# EasyEDA Pro project li-chuang-kai-fa-ban-li-chuang-esp32s3r8n8-kai-fa-ban-cb10375b.epro, board 立创ESP32S3R8N8开发板PCB
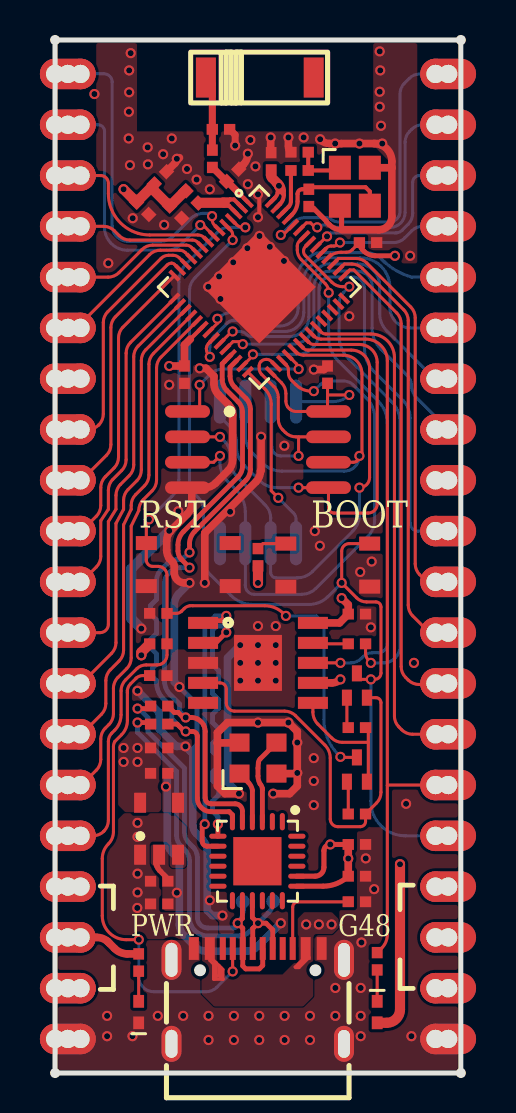
[diagram p2: board, top side]
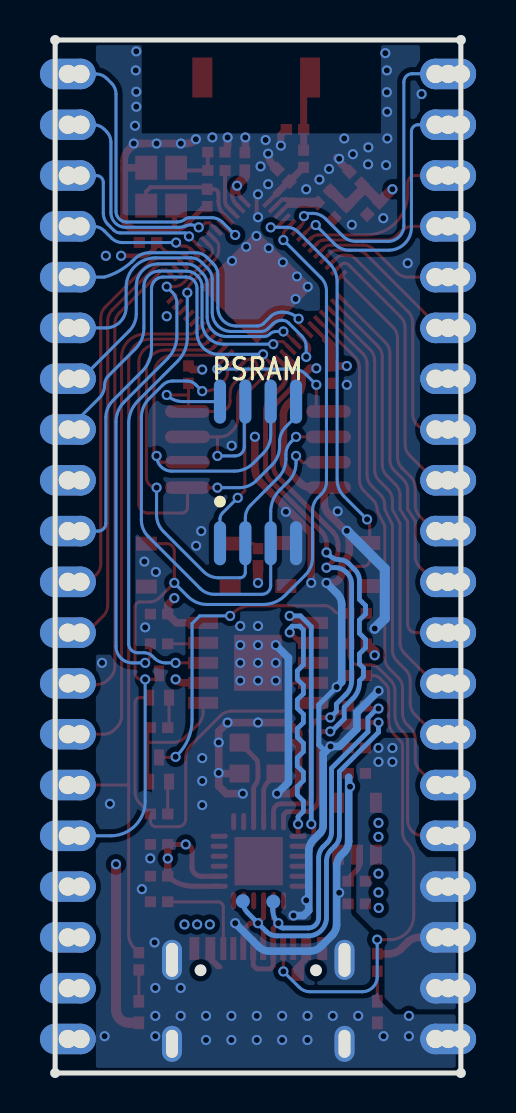
[diagram p3: board, bottom side, seen from below]

Outline 20.32 x 51.66 mm; copper layers: Top Layer, GND, VCC, Bottom Layer. Coordinates in mm from the lower left corner of the outline.
Outline path: 0,51.66 0,0 20.32,0 20.32,51.66 0,51.66
Stack: Top Layer 0.035mm 外层铜厚1oz / Dielectric1 0.2104mm 7628 RC49% 8.6mil / GND 0.0152mm 内层铜厚 / Dielectric2 1.065mm 1.1mm H/HOZ 含铜 / VCC 0.0152mm 内层铜厚 / Dielectric3 0.2104mm 7628 RC49% 8.6mil / Bottom Layer 0.035mm 外层铜厚1oz

## Design rules (mm)
net D4-: DP2
net D4+: DP2
net USB_D+: DP1
net USB_D-: DP1
net D3+: DP3
net D3-: DP3
spacing copperThickness1oz (default): track to track 0.102, other pairs 0 to 0.3
spacing copperThickness2oz: track to track 0.203, other pairs 0.152 to 0.3
spacing Plane_innerPlane: track to track 0.102, other pairs 0 to 0.3
spacing Copper_copperRegion: track to track 0.102, other pairs 0 to 0.3
track width copperThickness1oz (default): min 0.152, default 0.203, max 2.54
track width copperThickness2oz: min 0.203, default 0.254, max 2.54
differential pair 90Ω (default): width min 0.241, default 0.241, max 0.241; gap min 0.152, default 0.152
region e1 uses Copper_copperRegion
region e2 uses Copper_copperRegion
region e3 uses Copper_copperRegion
pour e1339 uses Copper_copperRegion
pour e1341 uses Copper_copperRegion
pour e1343 uses Copper_copperRegion
pour e1345 uses Copper_copperRegion
pour e1347 uses Copper_copperRegion
pour e1358 uses Copper_copperRegion

## Placement (name value [footprint] x y rotation side)
BOOT  TSA016A2518A  [KEY-SMD_4P-L4.2-W3.4-P2.15-LS4.5-TL]  13.65 25.4 0 top
C19  100nF  [R0402]  6.03 43.05 135 top
C20  100nF  [R0402]  15.67 41.53 180 top
C21  100nF  [R0402]  10.82 45.59 270 top
C22  100nF  [R0402]  6.48 34.92 90 top
C23  100nF  [R0402]  13.64 34.92 270 top
C25  1uF  [R0402]  5.17 22.99 0 top
C33  10pF  [R0402]  12.24 46.05 0 top
C34  10pF  [R0402]  12.7 43.76 270 top
C41  100nF  [R0402]  15.11 22.95 180 top
C46  10uF  [R0402]  5.21 8.46 180 top
C47  10uF  [R0402]  4.38 43.24 135 top
C48  10uF  [R0402]  15.11 9.84 180 top
C49  100nF  [R0402]  15.11 11.43 180 top
C50  1uF  [R0402]  5.27 44.77 225 top
C51  100nF  [R0402]  5.21 16.26 180 top
C52  100nF  [R0402]  5.21 9.59 180 top
C53  10uF  [R0402]  5.21 14.99 180 top
C54  8.2pF  [r0402]  7.87 45.72 270 top
J1  -  [半孔-孔-20P-2.54-1.27-无丝印]  19.05 25.83 90 top
J2  -  [半孔-孔-20p-2.54-1.27-无丝印]  0 25.83 90 top
L4  2nH  [R0402]  6.86 43.81 315 top
L6  39nH  [r0402]  8.89 44.89 45 top
L7  1.3nH  [r0402]  8.31 47.19 0 top
L8  24nH  [r0402]  12.24 45.14 0 top
LED1  XL-1005UGC  [LED0402-RD_GREEN]  16.13 3.05 270 top
PWR  NCD0402R1  [LED0402-RD]  4.18 3.05 90 top
Q1  MMBT3904T  [SOT-523_L1.6-W0.8-P1.00-BL]  15.11 19.38 0 top
Q2  MMBT3904T  [SOT-523_L1.6-W0.8-P1.00-BL]  15.11 15.18 0 top
R13  4.7kΩ  [R0402]  4.18 5.52 270 top
R14  4.7kΩ  [R0402]  10.16 25.79 270 top
R15  4.7kΩ  [R0402]  5.17 21.46 180 top
R16  4.7kΩ  [R0402]  15.11 12.95 180 top
R17  4.7kΩ  [R0402]  15.11 17.27 180 top
R18  5.1kΩ  [R0402]  5.17 19.88 180 top
R19  5.1kΩ  [R0402]  15.11 8.56 180 top
R22  0Ω  [R0402]  5.21 17.45 0 top
R23  0Ω  [R0402]  5.21 18.35 0 top
R24  499Ω  [R0402]  15.11 21.46 180 top
R25  15kΩ  [R0402]  16.13 5.59 90 top
RST  TSA016A2518A  [KEY-SMD_4P-L4.2-W3.4-P2.15-LS4.5-TL]  6.67 25.43 180 top
TP1  -  [test-point-0.5mm]  10.92 8.59 180 bottom
TP2  -  [test-point-0.5mm]  9.4 8.57 180 bottom
U2  USB-TYPE-C-019  [TYPE-C-SMD_HX-TYPE-C-16PIN]  10.15 3.84 0 top
U3  ESP32-S3(R8)  [QFN-56_L7.0-W7.0-P0.40-TL-EP4.0]  10.22 39.31 315 top
U4  -  [SOP-8_L5.3-W5.3-P1.27-LS8.0-BL]  10.16 30.04 180 bottom
U5  BY25Q64ASSIG(T)  [SOIC-8_L5.3-W5.3-P1.27-LS8.0-BL]  10.16 31.18 270 top
U6  ME6217C33M5G  [sot-23-5_l3.0-w1.7-p0.95-ls2.8-br]  5.21 12.22 270 top
U16  CH334F  [qfn24_4x4]  10.13 10.59 180 top
U24  CH340K  [ESOP-10_L4.9-W3.9-P1.00-LS6.2-BL-EP]  10.16 20.51 270 top
U25  RFANT5220110A0T  [FILTER-SMD_L5.2-W2.0-L]  10.25 49.78 0 top
X1  40MHz  [crystal-smd_4p-l2.5-w2.0-bl]  15.01 44.32 270 top
X2  12MHz  [crystal-smd_4p-l2.5-w2.0-bl-a]  10.16 15.75 0 top

## Footprints (pads in the part's own frame, mm; a bottom-side part is the same pattern mirrored in y, then rotated)
crystal-smd_4p-l2.5-w2.0-bl
  rect 1.2x1.1 smd: 1(-0.95,-0.75) 2(0.95,-0.75) 3(0.95,0.75) 4(-0.95,0.75)
crystal-smd_4p-l2.5-w2.0-bl-a
  rect 1x0.9 smd: 1(-0.925,-0.775) 2(0.925,-0.775) 3(0.925,0.775) 4(-0.925,0.775)
ESOP-10_L4.9-W3.9-P1.00-LS6.2-BL-EP
  rect 0.6x1.5 smd: 1(-2,-2.75) 2(-1,-2.75) 3(0,-2.75) 4(1,-2.75) 5(2,-2.75) 6(2,2.75) 7(1,2.75) 8(0,2.75) 9(-1,2.75) 10(-2,2.75)
  rect 2.8x2.4 smd: 11(0,0)
FILTER-SMD_L5.2-W2.0-L
  rect 1x2 smd: 1(-2.7,0) 2(2.7,0)
KEY-SMD_4P-L4.2-W3.4-P2.15-LS4.5-TL
  rect 1.05x0.7 smd: 1(-2.1,1.075) 2(2.1,1.075) 3(-2.1,-1.075) 4(2.1,-1.075)
LED0402-RD
  rect 0.636x0.54 smd: 1(-0.538,0) 2(0.538,0)
LED0402-RD_GREEN
  rect 0.636x0.54 smd: 1(-0.538,0) 2(0.538,0)
qfn24_4x4
  rect 2.413x2.413 smd: 0(0,0)
  oval 0.25x0.864 smd: 1(-1.25,-1.976) 2(-0.75,-1.976) 3(-0.25,-1.976) 4(0.25,-1.976) 5(0.75,-1.976) 6(1.25,-1.976) 13(1.25,1.976) 14(0.75,1.976) 15(0.25,1.976) 16(-0.25,1.976) 17(-0.75,1.976) 18(-1.25,1.976)
  oval 0.864x0.25 smd: 7(1.976,-1.25) 8(1.976,-0.75) 9(1.976,-0.25) 10(1.976,0.25) 11(1.976,0.75) 12(1.976,1.25) 19(-1.976,1.25) 20(-1.976,0.75) 21(-1.976,0.25) 22(-1.976,-0.25) 23(-1.976,-0.75) 24(-1.976,-1.25)
QFN-56_L7.0-W7.0-P0.40-TL-EP4.0
  rect 0.665x0.2 smd: 1(-3.408,2.6) 2(-3.407,2.2) 3(-3.408,1.8) 4(-3.408,1.4) 5(-3.408,1) 6(-3.407,0.6) 7(-3.408,0.2) 8(-3.408,-0.2) 9(-3.407,-0.6) 10(-3.408,-1) 11(-3.408,-1.4) 12(-3.408,-1.8) 13(-3.407,-2.2) 14(-3.408,-2.6) 29(3.408,-2.6) 30(3.407,-2.2) 31(3.408,-1.8) 32(3.408,-1.4) 33(3.408,-1) 34(3.407,-0.6) 35(3.408,-0.2) 36(3.408,0.2) 37(3.407,0.6) 38(3.408,1) 39(3.408,1.4) 40(3.408,1.8) 41(3.407,2.2) 42(3.408,2.6)
  rect 0.2x0.665 smd: 15(-2.6,-3.408) 16(-2.2,-3.407) 17(-1.8,-3.408) 18(-1.4,-3.408) 19(-1,-3.408) 20(-0.6,-3.407) 21(-0.2,-3.408) 22(0.2,-3.408) 23(0.6,-3.407) 24(1,-3.408) 25(1.4,-3.408) 26(1.8,-3.408) 27(2.2,-3.407) 28(2.6,-3.408) 43(2.6,3.408) 44(2.2,3.407) 45(1.8,3.408) 46(1.4,3.408) 47(1,3.408) 48(0.6,3.407) 49(0.2,3.408) 50(-0.2,3.408) 51(-0.6,3.407) 52(-1,3.408) 53(-1.4,3.408) 54(-1.8,3.408) 55(-2.2,3.407) 56(-2.6,3.408)
  rect 4x4 smd: 57(0,0)
r0402
  rect 0.566x0.54 smd: 1(-0.433,0) 2(0.433,0)
R0402
  rect 0.566x0.54 smd: 1(-0.433,0) 2(0.433,0)
SOIC-8_L5.3-W5.3-P1.27-LS8.0-BL
  oval 0.63x2.25 smd: 1(-1.905,-3.53) 2(-0.635,-3.53) 3(0.635,-3.53) 4(1.905,-3.53) 5(1.905,3.53) 6(0.635,3.53) 7(-0.635,3.53) 8(-1.905,3.53)
SOP-8_L5.3-W5.3-P1.27-LS8.0-BL
  oval 0.609x2.204 smd: 1(-1.905,-3.542) 2(-0.635,-3.542) 3(0.635,-3.542) 4(1.905,-3.542) 5(1.905,3.542) 6(0.635,3.542) 7(-0.635,3.542) 8(-1.905,3.542)
sot-23-5_l3.0-w1.7-p0.95-ls2.8-br
  rect 1x0.6 smd: 1(1.3,-0.95) 2(1.3,0) 3(1.3,0.95) 4(-1.3,0.95) 5(-1.3,-0.95)
SOT-523_L1.6-W0.8-P1.00-BL
  rect 0.5x0.8 smd: 1(-0.5,-0.608) 2(0.5,-0.608) 3(0,0.608)
test-point-0.5mm
  round 0.7 smd: 1(0,0)
TYPE-C-SMD_HX-TYPE-C-16PIN
  oval 1x2 hole 0.6x1.7: 1(-4.32,1.816) 1(4.32,1.816)
  oval 1x1.8 hole 0.6x1.4: 1(-4.32,-2.384) 1(4.32,-2.384)
  rect 0.5x1.14 smd: A1(-3.2,2.384) A4(-2.4,2.384) A9(2.4,2.384) A12(3.2,2.384)
  rect 0.3x1.14 smd: A5(-1.25,2.383) A6(-0.25,2.383) A7(0.25,2.383) A8(1.25,2.384) B5(1.75,2.383) B6(0.75,2.383) B7(-0.75,2.383) B8(-1.75,2.384)
半孔-孔-20p-2.54-1.27-无丝印
  round 1.524 hole 0.914: 1(-24.13,0) 1(-24.13,-1.27) 2(-21.59,0) 2(-21.59,-1.27) 3(-19.05,0) 3(-19.05,-1.27) 4(-16.51,0) 4(-16.51,-1.27) 5(-13.97,0) 5(-13.97,-1.27) 6(-11.43,0) 6(-11.43,-1.27) 7(-8.89,0) 7(-8.89,-1.27) 8(-6.35,0) 8(-6.35,-1.27) 9(-3.81,0) 9(-3.81,-1.27) 10(-1.27,0) 10(-1.27,-1.27) 11(1.27,0) 11(1.27,-1.27) 12(3.81,0) 12(3.81,-1.27) 13(6.35,0) 13(6.35,-1.27) 14(8.89,0) 14(8.89,-1.27) 15(11.43,0) 15(11.43,-1.27) 16(13.97,0) 16(13.97,-1.27) 17(16.51,0) 17(16.51,-1.27) 18(19.05,0) 18(19.05,-1.27) 19(21.59,0) 19(21.59,-1.27) 20(24.13,0) 20(24.13,-1.27)
  oval 1.524x2.794 hole 0.914: 1(-24.13,-0.635) 2(-21.59,-0.635) 3(-19.05,-0.635) 4(-16.51,-0.635) 5(-13.97,-0.635) 6(-11.43,-0.635) 7(-8.89,-0.635) 8(-6.35,-0.635) 9(-3.81,-0.635) 10(-1.27,-0.635) 11(1.27,-0.635) 12(3.81,-0.635) 13(6.35,-0.635) 14(8.89,-0.635) 15(11.43,-0.635) 16(13.97,-0.635) 17(16.51,-0.635) 18(19.05,-0.635) 19(21.59,-0.635) 20(24.13,-0.635)
半孔-孔-20P-2.54-1.27-无丝印
  round 1.524 hole 0.914: 1(-24.13,0) 2(-21.59,0) 3(-19.05,0) 4(-16.51,0) 5(-13.97,0) 6(-11.43,0) 7(-8.89,0) 8(-6.35,0) 9(-3.81,0) 10(-1.27,0) 11(1.27,0) 12(3.81,0) 13(6.35,0) 14(8.89,0) 15(11.43,0) 16(13.97,0) 17(16.51,0) 18(19.05,0) 19(21.59,0) 20(24.13,0)
  oval 1.524x2.794 hole 0.914: 1(-24.13,-0.635) 2(-21.59,-0.635) 3(-19.05,-0.635) 4(-16.51,-0.635) 5(-13.97,-0.635) 6(-11.43,-0.635) 7(-8.89,-0.635) 8(-6.35,-0.635) 9(-3.81,-0.635) 10(-1.27,-0.635) 11(1.27,-0.635) 12(3.81,-0.635) 13(6.35,-0.635) 14(8.89,-0.635) 15(11.43,-0.635) 16(13.97,-0.635) 17(16.51,-0.635) 18(19.05,-0.635) 19(21.59,-0.635) 20(24.13,-0.635)

## Nets
As in the schematic.

Pads without a net: RST 3; U2 A8 B8; U16 1 2 9 10 11 12 13 16 17 18 21 22 23 24; U24 5; U25 2

## Via types
v1: diameter 0.508, hole 0.305, Top Layer to Bottom Layer, 187 vias

## Routing (per net, layer and track width the routed paths; a pad name or vN(x,y) marks a point on that pad's centre or on a via; arc(x,y) is an arc through that point)
3V3: length 44.9
  Top Layer w0.152: 14.88,41.17 C20.2 ; 13.62,40.73 13.67,40.78 arc(13.97,40.98) 14.33,41.05 14.58,41.05 arc(14.74,41.08) 14.88,41.17
  Top Layer w0.203: 11.15,44.03 11.15,44.04 arc(11.14,44.16) 11.1,44.28 ; 11.15,44.03 arc(11.17,44.11) 11.18,44.2 ; 11.15,44.03 arc(11.09,43.88) 10.99,43.75 U3.56 ; 6.73,36.7 6.77,36.7 7.39,37.32 ; 11.46,43.92 11.18,44.2 ; 11.46,43.92 11.46,44.12 ; 11.46,43.92 arc(11.41,43.67) 11.27,43.46 U3.55 ; 11.18,44.2 arc(11.14,44.24) 11.1,44.28 ; 11.46,44.12 v1(11.21,44.37) 10.97,44.61 arc(10.93,44.63) 10.89,44.64 ; 11.46,44.12 arc(11.41,44.35) 11.28,44.55 10.93,44.9 arc(10.85,45.02) C21.2 10.82,45.05 arc(10.84,44.85) 10.89,44.64 ; 10.99,44.44 10.75,44.68 arc(10.68,44.78) 10.66,44.9 ; 10.99,44.44 arc(11.05,44.36) 11.1,44.28 ; 10.99,44.44 arc(11.04,44.36) 11.1,44.28 ; 10.99,44.44 arc(10.94,44.54) 10.89,44.64
  Top Layer w0.241: v1(17.02,40.87) 16.02,40.87 arc(15.72,40.93) 15.47,41.1 15.38,41.18 arc(15.28,41.34) C20.2
  Top Layer w0.254: 14.68,11.43 v1(13.78,11.43) arc(13.55,11.34) 13.46,11.11 13.46,10.29 arc(13.33,9.97) 13.02,9.84 U16.20 ; U16.19 13.42,9.34 arc(14.1,9.47) 14.68,9.84
  Top Layer w0.381: U24.7 13.87,19.51 arc(14.09,19.56) v1(14.29,19.69) ; 0.62,6.78 J2.3 2.09,6.78 arc(2.37,6.73) 2.62,6.59 ; 14.68,9.84 v1(14.68,10.73) 14.68,11.43 ; 6.77,36.7 6.48,36.41 C22.2 v1(5.72,35.36) ; U24.10 14.24,22.51 14.68,22.95 14.68,23.42 v1(14.35,23.75) ; 2.62,6.59 2.98,6.23 arc(3.27,6.03) 3.61,5.96 R13.1 ; 2.62,6.59 arc(2.67,6.54) 2.72,6.48
  Top Layer w0.508: 6.55,44.15 5.76,43.36 C19.2 4.81,44.28 ; 4.81,44.28 4.96,44.44 C50.2 ; 4.81,44.28 C47.2 v1(3.43,44.2) ; 4.74,21.46 4.32,21.04 v1(4.32,20.89) ; R14.2 v1(10.16,24.51) ; v1(17.27,10.44) 17.27,3.17 arc(17.08,2.7) 16.61,2.51 LED1.2
  vias: v1(3.43,16.26) v1(3.43,15.56) v1(4.13,16.26) v1(4.13,15.56)
+5V: length 9.2
  Top Layer w0.152: 7.93,4.84 7.93,5.44 7.75,5.63 7.75,5.83 ; 7.93,4.84 8.06,4.84 ; 7.93,4.84 7.93,4.7 7.95,4.68 8.41,4.68 8.4,4.69 ; 8.06,4.84 8.04,4.86 8.04,5.53 ; 8.06,4.84 8.26,4.84 ; 8.06,4.84 8.06,5.51 ; 8.3,5.28 8.4,5.17 8.4,4.69 ; 8.3,5.28 8.3,4.87 8.26,4.84 ; 8.3,5.28 8.2,5.37 ; 12.12,5.3 12.55,5.73 12.55,5.83 ; 8.26,4.84 8.2,4.89 8.2,5.37 ; 8.26,4.84 8.4,4.69 ; 8.2,5.37 8.06,5.51 ; 12.72,5.78 12.72,5.78 12.21,5.27 12.05,5.27 12.02,5.3 12.55,5.83 ; 12.55,5.83 U2.A9 ; 8.04,5.53 8.06,5.51 ; 8.04,5.53 7.75,5.83 ; 7.75,5.83 U2.A4
  vias: v1(4.13,12.51) v1(4.13,11.81) v1(4.13,9.97) v1(4.13,9.03) v1(4.12,8.25) v1(12.57,7.43) v1(13.21,7.43) v1(13.84,7.43)
GND: length 110.6
  Top Layer w0.152: 5.64,9.8 5.32,10.12 arc(5.19,10.32) 5.14,10.55 ; 5.45,9.84 5.19,10.09 arc(5.04,10.32) 4.99,10.59
  Top Layer w0.203: v1(10.16,43.94) 10.23,43.88 10.23,42.87 v1(10.16,42.8)
  Top Layer w0.254: X1.2 arc(14.32,43.28) 14.35,43.17 14.35,42.17 arc(14.02,42.24) 13.74,42.42 13.59,42.57 arc(13.58,42.59) 13.57,42.61 12.96,43.23 arc(12.84,43.3) 12.7,43.33
  Top Layer w0.35: 8.74,47.19 9.02,46.92 v1(9.02,46.38)
  Top Layer w0.381: C50.1 6.01,45.5 arc(6.07,45.6) v1(6.1,45.72) arc(6.17,45.73) 6.23,45.77 ; v1(7.24,35.24) 7.56,35.24 7.95,34.84 7.95,34.47 arc(8.01,34.18) 8.18,33.93 8.67,33.44 arc(8.83,33.19) 8.89,32.9 8.89,30.67 arc(8.83,30.38) 8.67,30.13 8.03,29.5 arc(7.79,29.33) 7.5,29.27 U5.4 6.85,29.06 6.85,28.5 arc(6.79,28.21) 6.62,27.96 5.81,27.15 arc(5.72,27.03) 5.65,26.9 arc(5.6,26.76) 5.59,26.61 5.59,26.15 arc(5.62,25.92) 5.72,25.71 5.87,25.57 arc(5.94,25.46) 5.97,25.33 5.97,25.02 arc(6.12,24.66) 6.48,24.51 v1(6.73,24.51) ; 8.13,16.51 8.13,14.35 8.51,13.97 v1(9.21,13.97) ; 8.13,16.51 8.13,17.02 8.64,17.53 v1(10.16,17.53) v1(11.68,17.53) 12.13,17.08 v1(12.13,16.53) v1(12.13,15.01) ; 8.13,16.51 9.22,16.51 9.24,16.52 ; v1(10.31,31.82) 10.31,30.14 10.29,30.11 arc(10.23,29.82) 10.06,29.57 7.5,27.01 v1(7.5,24.51) ; v1(14.03,46.48) 13.74,46.48 arc(13.51,46.53) 13.31,46.66 v1(13.27,46.7) ; v1(12.13,15.01) 12.13,14.35 11.75,13.97 v1(10.92,13.97) ; v1(12.13,15.01) 12.09,14.97 X2.2 ; v1(12.95,35.18) 13.46,35.18 C23.1 ; v1(10.79,46.79) 10.79,46.09 arc(10.8,46.05) C21.1 ; 16.87,45.27 16.87,42.82 arc(16.67,42.36) 16.21,42.17 14.35,42.17 ; 16.87,45.27 16.87,45.59 arc(16.72,46.07) 16.35,46.4 arc(16.17,46.46) 15.98,46.48 ; 16.87,45.27 X1.4 ; v1(16.38,46.48) 15.98,46.48 ; 15.98,46.48 v1(15.24,46.48) 14.34,46.48 arc(14.19,46.47) 14.05,46.42 ; L6.2 9.43,45.43 arc(9.59,45.68) v1(9.65,45.97) ; v1(11.68,46.79) 11.68,46.35 arc(11.72,46.19) C33.1
  Bottom Layer w0.254: 6.78,16.08 7.11,16.41 7.11,18.42 v1(6.22,19.3)
  Bottom Layer w0.381: v1(9.21,13.97) 8.64,14.54 8.64,20.76 v1(9.27,21.4) ; v1(8.38,7.87) 7.87,7.87 7.62,8.13 7.62,11.11 arc(7.56,11.41) 7.4,11.65 7.05,12 arc(6.94,12.17) 6.9,12.37 6.9,15.96 v1(6.53,16.33) 6.08,16.33 5.21,17.21 5.21,18.03 v1(4.13,19.11) ; v1(11.3,7.49) 10.13,6.32 arc(9.88,6.15) 9.59,6.1 7.55,6.1 arc(7.26,6.15) 7.02,6.32 6.45,6.89 arc(6.28,7.14) 6.22,7.43 6.22,10.35 arc(6.16,10.64) 6,10.89 5.84,11.05 arc(5.68,11.3) 5.62,11.59 5.62,14.79 ; v1(6.22,19.3) 5.97,19.56 5.97,23.43 arc(6.03,23.72) 6.19,23.97 v1(6.73,24.51)
  Bottom Layer w0.508: v1(4.32,22.22) 3.81,22.73 3.81,25.21 v1(5.72,27.11)
  vias: v1(1.97,48.96) v1(2.6,2.86) v1(2.6,1.84) v1(2.66,40.5) v1(3.71,50.14) v1(3.71,49.05) v1(3.7,48.07) v1(3.68,46.74) v1(3.75,45.4) v1(3.78,51) v1(3.89,42.75) v1(3.87,1.84) v1(4.64,46.29) v1(4.65,45.44) v1(5.14,2.86) v1(5.41,45.95) v1(5.46,42.42) v1(5.55,14.32) v1(5.72,34.42) v1(5.84,46.74) v1(6.1,9.02) v1(6.17,28.09) v1(6.41,2.86) v1(6.6,45.21) v1(7.08,44.68) v1(7.75,44.2) v1(7.67,39.32) v1(7.75,8.64) v1(7.68,2.86) v1(7.68,1.65) v1(8.21,39.84) v1(8.28,38.71) v1(8.76,28.07) v1(8.92,40.54) v1(8.95,2.86) v1(8.95,1.65) v1(9.27,20.51) v1(9.27,19.62) v1(9.63,41.25) v1(9.65,44.45) v1(9.78,46.66) v1(10.03,45.34) v1(10.24,41.86) v1(10.16,22.35) v1(10.16,21.4) v1(10.16,20.51) v1(10.16,19.62) v1(10.22,2.86) v1(10.22,1.65) v1(10.75,41.32) v1(11.05,22.35) v1(11.05,21.4) v1(11.05,20.51) v1(11.05,19.62) v1(11.46,40.61) v1(11.48,31.37) v1(11.49,2.86) v1(11.49,1.65) v1(12.45,46.79) v1(12.76,2.86) v1(12.76,1.65) v1(13,27.1) v1(12.95,15.75) v1(12.95,14.61) v1(12.95,13.4) v1(13.26,26.36) v1(14.03,4.25) v1(14.03,2.86) v1(14.73,37.85) v1(15.28,25.06) v1(15.34,6.53) v1(15.3,4.25) v1(15.3,2.86) v1(15.3,1.84) v1(15.56,10.73) v1(15.81,22.29) v1(15.85,25.58) v1(15.98,9.19) v1(16.26,51.09) v1(16.28,50.14) v1(16.26,49.07) v1(16.26,48.32) v1(16.32,47.37) v1(17.58,13.46) v1(17.78,40.87) v1(17.84,1.84) v1(17.97,20.51)
VDD_SPI: length 9.6
  Top Layer w0.152: 13.64,34.62 13.64,33.93 ; 13.64,33.93 13.64,33.13 U5.8 12.08,33.08 arc(11.92,33.11) 11.78,33.18 arc(11.71,33.24) 11.65,33.31 arc(11.58,33.45) 11.56,33.61 11.56,33.98 arc(11.5,34.27) 11.33,34.52 U3.29 ; 13.64,33.93 13.66,33.91 v1(14.73,33.91)
  Bottom Layer w0.152: U4.8 13.93,33.58 arc(14.37,33.66) v1(14.73,33.91)
340_RX: length 1.8
  Top Layer w0.152: U24.9 12.96,21.46 14.68,21.46
340_TX: length 26.3
  Top Layer w0.152: v1(13.7,39.02) 13.7,39.07 arc(13.66,39.29) 13.53,39.47 12.33,40.68 arc(12.18,40.9) 12.13,41.16 12.13,41.36 arc(12.15,41.48) 12.22,41.59 U3.50 ; U24.8 v1(14.29,20.51)
  Bottom Layer w0.152: v1(13.7,39.02) 13.7,36.78 arc(13.83,36.14) 14.19,35.59 16.17,33.61 arc(16.52,33.1) 16.64,32.49 16.64,21.47 arc(16.51,21.15) 16.19,21.02 15.88,21.02 arc(15.64,20.97) 15.44,20.84 15.34,20.74 arc(15.09,20.57) 14.79,20.51 v1(14.29,20.51)
CHIP_PU: length 53.3
  Top Layer w0.152: 5.6,22.99 5.6,24.89 arc(5.47,25.21) 5.16,25.34 4.89,25.34 arc(4.66,25.43) 4.57,25.66 RST.4 4.57,27.37 arc(4.6,27.54) v1(4.7,27.69) ; 5.6,22.99 5.6,20.91 arc(5.56,20.7) 5.43,20.53 arc(5.35,20.47) 5.26,20.43 arc(5.18,20.41) 5.1,20.41 4.56,20.41 arc(4.32,20.36) 4.1,20.23 3.53,19.66 arc(3.36,19.41) 3.3,19.1 3.3,17.91 arc(3.22,17.5) 2.98,17.14 2.84,17 arc(2.71,16.81) 2.67,16.58 2.67,12.63 arc(2.61,12.34) 2.44,12.1 2.43,12.08 arc(2.19,11.92) 1.89,11.86 J2.5 ; 5.6,22.99 6.07,22.99 arc(6.21,23.01) 6.33,23.09 ; v1(14.29,15.81) 14.31,15.78 Q2.3 ; U3.4 9.09,42.42 arc(9.23,42.33) 9.41,42.29 v1(9.53,42.29) ; v1(11.56,22.86) 11.44,22.98 arc(11.01,23.27) 10.5,23.37 6.89,23.37 arc(6.82,23.37) 6.75,23.37 arc(6.59,23.32) 6.46,23.22 6.33,23.09 ; 6.33,23.09 arc(6.33,23.1) 6.34,23.1
  Bottom Layer w0.152: v1(9.53,42.29) 8.7,42.29 arc(8.41,42.23) 8.16,42.07 6.59,40.5 arc(6.3,40.06) 6.2,39.55 6.2,29.67 arc(6.11,29.22) 5.85,28.84 v1(4.7,27.69) ; v1(14.29,15.81) 14.19,15.91 arc(13.65,16.72) 13.46,17.67 13.46,22.48 13.08,22.86 v1(11.56,22.86)
D3+: length 14.3
  Top Layer w0.241: v1(8.57,22.86) 8.33,22.62 7.52,22.62 U24.1 ; U16.8 7.62,11.34 arc(7.44,11.42) 7.37,11.59 7.37,12.32 v1(7.49,12.45)
  Bottom Layer w0.241: v1(8.57,22.86) 8.03,22.86 7.49,22.32 v1(7.49,12.45)
D3-: length 14.1
  Top Layer w0.241: U16.7 v1(8.15,12.45) ; U24.2 8.05,21.51 v1(8.57,22.03)
  Bottom Layer w0.241: v1(8.15,12.45) 8.15,12.82 7.89,13.09 7.89,13.6 8.19,13.9 8.19,14.32 7.89,14.63 7.89,15.05 8.19,15.35 8.19,15.77 7.89,16.08 7.89,16.49 8.19,16.8 8.19,17.22 7.89,17.52 7.89,17.94 8.19,18.25 8.19,18.67 7.89,18.97 7.89,19.39 8.19,19.69 8.19,20.11 7.89,20.42 7.89,22.16 8.07,22.35 8.45,22.35 8.57,22.22 v1(8.57,22.03)
D4+: length 29.8
  Top Layer w0.241: U16.6 8.88,12.91 8.72,13.07 7.81,13.07 arc(7.32,13.27) 7.12,13.75 7.12,16.84 arc(7.05,17.01) 6.88,17.08 v1(6.54,17.08) 6.48,17.08 6.11,17.45 R22.2 ; 9.09,35.62 8.76,35.3 8.76,34.85 arc(8.82,34.56) 8.98,34.31 9.56,33.74 arc(9.72,33.49) 9.78,33.2 9.78,30.19 arc(9.72,29.9) 9.56,29.65 6.98,27.08 arc(6.8,26.8) 6.73,26.47 v1(6.73,26.03)
  Bottom Layer w0.241: v1(6.73,26.03) 6.57,25.88 arc(6.34,25.72) 6.06,25.67 arc(5.83,25.62) 5.62,25.48 5.3,25.16 arc(5.14,24.92) 5.08,24.62 5.08,23.68 4.78,23.38 4.78,22.96 5.08,22.65 5.08,21.99 4.78,21.68 4.78,21.27 5.08,20.96 5.08,20.45 4.88,20.25 4.88,19.82 5.08,19.62 5.08,19.53 arc(5.17,19.09) 5.42,18.71 5.84,18.29 5.84,17.72 6.48,17.08 v1(6.54,17.08)
D4-: length 30
  Top Layer w0.241: R23.2 5.97,18.03 6.16,18.03 6.41,17.78 v1(6.54,17.78) 6.81,17.78 arc(6.97,17.76) 7.12,17.71 arc(7.31,17.57) 7.44,17.39 arc(7.5,17.23) 7.52,17.07 7.52,13.76 arc(7.6,13.55) 7.81,13.46 9.02,13.46 arc(9.27,13.36) 9.38,13.1 U16.5 ; U3.25 8.5,35.61 8.5,35.6 8.37,35.47 8.37,34.69 arc(8.42,34.39) 8.59,34.15 9.16,33.57 arc(9.33,33.33) 9.39,33.04 9.39,30.35 arc(9.33,30.06) 9.16,29.81 6.43,27.08 arc(6.22,26.77) 6.15,26.41 6.15,26.11 arc(6.19,25.91) 6.29,25.73 arc(6.31,25.71) 6.33,25.69 6.35,25.67 arc(6.54,25.47) v1(6.73,25.27)
  Bottom Layer w0.241: v1(6.54,17.78) 6.24,18.08 6.24,18.45 5.76,18.92 arc(5.55,19.24) 5.47,19.62 5.47,24.46 arc(5.53,24.75) 5.7,25 5.75,25.05 arc(5.99,25.22) 6.28,25.27 v1(6.73,25.27)
DTR: length 20.9
  Top Layer w0.152: U24.4 8.26,19.51 arc(8.48,19.42) 8.57,19.2 8.57,18.51 arc(8.69,18.22) 8.98,18.1 11.49,18.1 arc(11.79,18.04) 12.04,17.87 13.51,16.4 arc(13.71,16.1) 13.78,15.75 13.78,12.7 arc(13.89,12.43) 14.16,12.32 15.28,12.32 arc(15.47,12.4) 15.55,12.58 R16.1 16.1,13.51 arc(16.26,13.75) 16.32,14.04 16.32,18.52 arc(16.25,18.7) 16.07,18.77 Q1.2
GPIO0: length 47.9
  Top Layer w0.152: BOOT.2 14.73,26.47 arc(14.46,26.36) 14.35,26.1 v1(14.35,24.51) 15.1,23.76 arc(15.33,23.61) 15.59,23.56 16.07,23.56 arc(16.25,23.48) 16.32,23.3 16.32,20 arc(16.23,19.78) 16,19.69 v1(15.81,19.69) 15.24,19.69 15.11,19.81 15.11,19.99 ; v1(8.89,41.66) 8.89,41.92 arc(8.87,42.04) 8.8,42.15 8.52,42.42
  Bottom Layer w0.152: v1(14.35,24.51) 13.67,23.83 arc(13.23,23.53) 12.71,23.43 9.89,23.43 arc(9.31,23.55) 8.81,23.88 7.8,24.89 arc(7.53,25.3) 7.43,25.78 7.43,28.13 arc(7.36,28.48) 7.16,28.78 6.98,28.96 arc(6.8,29.24) 6.73,29.57 6.73,39.11 arc(6.8,39.47) 7.01,39.77 v1(8.89,41.66) ; v1(15.81,19.69) 15.81,13.59 arc(16.32,12.37) 17.54,11.86 J1.5
GPIO1: length 16.5
  Top Layer w0.152: v1(7.86,42.85) 7.86,42.7 arc(7.89,42.53) 7.99,42.39 U3.6
  Bottom Layer w0.152: J2.20 0.65,49.97 2.44,49.97 arc(2.74,49.85) 2.86,49.56 2.86,42.38 arc(3.09,41.82) 3.64,41.59 5.27,41.59 arc(5.62,41.66) 5.92,41.87 6.78,42.72 arc(7.08,42.92) 7.42,42.99 7.72,42.99 v1(7.86,42.85)
GPIO2: length 13.6
  Top Layer w0.152: 7.5,42.31 U3.7 ; v1(7.27,42.41) arc(7.4,42.38) 7.5,42.31
  Bottom Layer w0.152: v1(7.27,42.41) 6.31,41.45 arc(5.98,41.23) 5.59,41.15 3.62,41.15 arc(2.81,41.48) 2.48,42.29 2.48,47.09 arc(2.38,47.32) 2.14,47.42 J2.19
GPIO3: length 9.1
  Top Layer w0.152: U3.8 7.47,41.77 arc(7.32,41.87) 7.14,41.91 4.73,41.91 arc(4.45,41.93) 4.17,41.99 arc(3.09,42.73) 2.67,43.98 2.67,44.49 arc(2.55,44.77) 2.28,44.88 J2.18
GPIO4: length 7.1
  Top Layer w0.152: J2.17 2.43,42.34 arc(2.72,42.28) 2.97,42.12 3.21,41.88 arc(3.45,41.71) 3.74,41.66 6.87,41.66 arc(7.01,41.63) 7.13,41.55 U3.9
GPIO5: length 7.2
  Top Layer w0.152: 7.11,41.01 6.82,41.3 arc(6.7,41.37) 6.56,41.4 4.89,41.4 arc(4.6,41.34) 4.35,41.18 3.19,40.03 arc(2.95,39.86) 2.66,39.8 J2.16
GPIO6: length 7.9
  Top Layer w0.152: U3.11 6.52,41.03 arc(6.39,41.12) 6.23,41.15 5.27,41.15 arc(4.98,41.09) 4.73,40.92 1.07,37.26 J2.15
GPIO7: length 12.6
  Top Layer w0.152: 6.54,40.44 6.22,40.76 arc(6.08,40.86) 5.9,40.89 5.68,40.89 arc(5.48,40.85) 5.31,40.74 2.64,38.07 arc(2.47,37.82) 2.41,37.53 2.41,32.95 arc(2.35,32.66) 2.19,32.42 2.18,32.41 arc(1.93,32.24) 1.64,32.18 J2.13
GPIO8: length 13.9
  Top Layer w0.152: U3.13 5.98,40.44 arc(5.91,40.49) 5.84,40.5 arc(5.71,40.48) 5.61,40.41 3.02,37.81 arc(2.85,37.57) 2.79,37.28 2.79,31.43 arc(2.74,31.14) 2.57,30.89 1.54,29.86 arc(1.3,29.7) 1,29.64 J2.12
GPIO9: length 15.2
  Top Layer w0.152: U3.14 3.4,37.3 arc(3.23,37.05) 3.18,36.76 3.18,30.8 arc(3.12,30.5) 2.95,30.26 2.51,29.81 arc(2.34,29.57) 2.29,29.28 2.29,28.38 arc(2.23,28.09) 2.06,27.84 1.54,27.33 arc(1.3,27.16) 1,27.1 J2.11
GPIO10: length 16.6
  Top Layer w0.152: J2.10 1,24.56 arc(1.3,24.62) 1.54,24.78 2.06,25.3 arc(2.23,25.55) 2.29,25.84 2.29,27.62 2.67,28.19 2.67,29.15 arc(2.73,29.44) 2.89,29.69 3.33,30.13 arc(3.5,30.38) 3.56,30.67 3.56,36 arc(3.61,36.29) 3.78,36.54 U3.15
GPIO11: length 19.6
  Top Layer w0.152: U3.16 4.16,36.35 arc(3.99,36.11) 3.94,35.82 3.94,30.41 arc(3.88,30.12) 3.71,29.88 3.27,29.43 arc(3.11,29.19) 3.05,28.89 3.05,28.19 2.67,27.58 2.67,22.44 arc(2.54,22.14) 2.25,22.02 J2.9
GPIO12: length 21.3
  Top Layer w0.152: J2.8 1,19.48 arc(1.3,19.54) 1.54,19.7 2.82,20.99 arc(2.99,21.23) 3.05,21.52 3.05,27.49 3.43,28.19 3.43,28.64 arc(3.49,28.93) 3.65,29.18 4.09,29.62 arc(4.26,29.87) 4.32,30.16 4.32,35.63 arc(4.38,35.92) 4.54,36.17 6.54,38.17
GPIO13: length 23.6
  Top Layer w0.152: J2.7 1,16.94 arc(1.3,17) 1.54,17.17 2.32,17.94 arc(2.48,18.19) 2.54,18.48 2.54,19.62 arc(2.6,19.91) 2.76,20.16 3.21,20.61 arc(3.37,20.85) 3.43,21.14 3.43,27.41 3.81,28.19 3.81,28.39 arc(3.87,28.68) 4.03,28.92 4.48,29.37 arc(4.64,29.62) 4.7,29.91 4.7,35.45 arc(4.76,35.74) 4.92,35.98 6.82,37.89
GPIO14: length 25.3
  Top Layer w0.152: 7.11,37.6 5.3,35.8 arc(5.14,35.55) 5.08,35.26 5.08,29.65 arc(5.02,29.36) 4.86,29.11 4.41,28.67 arc(4.25,28.42) 4.19,28.13 3.81,27.35 3.81,20.76 arc(3.75,20.47) 3.59,20.22 3.14,19.78 arc(2.98,19.53) 2.92,19.24 2.92,17.97 arc(2.86,17.68) 2.7,17.43 2.51,17.24 arc(2.34,16.99) 2.29,16.7 2.29,15.68 arc(2.23,15.39) 2.06,15.14 1.27,14.35
GPIO15: length 16
  Top Layer w0.152: U3.21 8.13,37.49 v1(8.13,37.72)
  Bottom Layer w0.152: J1.16 17.86,39.8 arc(17.14,40.1) 16.5,40.55 ; 16.38,40.67 16.5,40.55 ; 16.38,40.67 arc(16.03,40.93) 15.6,41.02 13.27,41.02 arc(12.98,40.96) 12.73,40.8 12.39,40.46 arc(12.23,40.21) 12.17,39.92 12.17,38.27 arc(11.9,37.62) 11.26,37.36 10.19,37.36 arc(10.02,37.39) 9.87,37.49 9.54,37.83 arc(9.29,37.99) 9,38.05 8.93,38.05 arc(8.49,37.96) v1(8.13,37.72) ; 16.38,40.67 arc(16.44,40.61) 16.5,40.55
GPIO16: length 19.6
  Top Layer w0.152: v1(7.75,35.81) 7.74,35.82 arc(7.62,36.01) 7.57,36.22 arc(7.6,36.36) 7.68,36.48 U3.22
  Bottom Layer w0.152: J1.15 17.79,37.26 arc(17.06,37.56) 16.76,38.29 16.76,39.29 arc(16.33,40.33) 15.29,40.77 13.52,40.77 arc(13.23,40.71) 12.99,40.54 12.68,40.24 arc(12.51,39.99) 12.45,39.7 12.45,38.04 arc(12.17,37.36) 11.5,37.08 10.03,37.08 arc(9.82,37.13) 9.63,37.25 9.44,37.45 arc(9.22,37.59) 8.96,37.64 8.95,37.64 arc(8.78,37.61) 8.63,37.51 7.97,36.85 arc(7.8,36.61) 7.75,36.31 v1(7.75,35.81)
GPIO17: length 18.1
  Top Layer w0.152: U3.23 8.85,37.08 v1(8.89,37.08)
  Bottom Layer w0.152: v1(8.89,37.08) 9.25,37.08 arc(9.43,37.05) 9.57,36.95 arc(9.71,36.86) 9.86,36.83 11.73,36.83 arc(12.42,37.12) 12.71,37.81 12.71,39.44 arc(12.77,39.73) 12.93,39.98 13.19,40.24 arc(13.44,40.41) 13.73,40.46 15.15,40.46 arc(15.93,40.14) 16.26,39.36 16.26,37.97 arc(16.35,37.5) 16.61,37.11 19,34.72 J1.14
GPIO18: length 19.5
  Top Layer w0.152: v1(9.4,36.45) 9.27,36.58 8.91,36.58 8.52,36.19
  Bottom Layer w0.152: v1(9.4,36.45) 11.88,36.45 arc(12.64,36.77) 12.96,37.53 12.96,39.32 arc(13.02,39.61) 13.19,39.86 13.21,39.88 arc(13.46,40.04) 13.75,40.1 15.11,40.1 arc(15.65,39.88) 15.88,39.34 15.88,37.26 arc(15.99,36.69) 16.31,36.2 17.65,34.86 arc(17.79,34.65) 17.84,34.4 arc(17.91,34.05) 18.11,33.76 J1.13
GPIO21: length 24.6
  Top Layer w0.152: U3.27 9.91,35.88 v1(9.91,35.94)
  Bottom Layer w0.152: J1.11 18.17,27.1 arc(17.89,27.22) 17.78,27.49 17.78,32.78 arc(17.69,33.24) 17.43,33.62 15.97,35.08 arc(15.62,35.61) 15.49,36.23 15.49,39.22 arc(15.47,39.4) 15.39,39.56 arc(15.32,39.64) 15.25,39.7 arc(15.09,39.78) 14.91,39.81 13.78,39.81 arc(13.7,39.8) 13.62,39.78 arc(13.38,39.64) 13.24,39.4 arc(13.22,39.32) 13.22,39.24 13.22,37.03 arc(12.9,36.26) 12.13,35.94 v1(9.91,35.94)
GPIO38: length 24.2
  Top Layer w0.152: U3.43 14.75,40.16 14.96,40.16 17.11,38.01 arc(17.27,37.76) 17.33,37.47 17.33,20.32 arc(17.39,20.03) 17.55,19.78 17.68,19.65 arc(17.93,19.49) 18.22,19.43 19.63,19.43
GPIO39: length 21.8
  Top Layer w0.152: J1.9 19.06,22.02 arc(18.77,22.08) 18.52,22.25 17.91,22.86 arc(17.74,23.11) 17.68,23.4 17.68,37.63 arc(17.63,37.92) 17.46,38.17 15.39,40.23 arc(15.15,40.4) 14.85,40.46 14.48,40.46 U3.44
GPIO40: length 19.4
  Top Layer w0.152: U3.45 14.2,40.73 15.07,40.73 arc(15.36,40.68) 15.61,40.51 17.81,38.31 arc(17.98,38.06) 18.03,37.77 18.03,25.46 arc(18.09,25.17) 18.26,24.92 18.62,24.56 J1.10
GPIO41: length 6.8
  Top Layer w0.152: v1(14.26,41.53) 14.18,41.45 arc(14.08,41.38) 13.96,41.36 13.83,41.36 arc(13.7,41.33) 13.59,41.26 U3.47
  Bottom Layer w0.152: J1.17 18.4,42.34 arc(18.11,42.28) 17.86,42.12 17.5,41.75 arc(17.25,41.59) 16.96,41.53 v1(14.26,41.53)
GPIO42: length 9.2
  Top Layer w0.152: v1(13.62,41.84) 13.6,41.84 U3.48
  Bottom Layer w0.152: v1(13.62,41.84) 13.79,42.01 17.05,42.01 arc(17.23,42.05) 17.38,42.15 17.68,42.45 arc(17.85,42.7) 17.91,42.99 17.91,44.54 arc(18.01,44.78) 18.25,44.88 J1.18
GPIO45: length 12.2
  Top Layer w0.152: v1(13.13,42.29) 13.02,42.29 12.8,42.51 12.58,42.51 U3.51
  Bottom Layer w0.152: J1.19 18.4,47.42 arc(18.11,47.36) 17.86,47.2 17.75,47.09 arc(17.58,46.84) 17.53,46.55 17.53,43.03 arc(17.31,42.51) 16.79,42.29 14.12,42.29 arc(13.96,42.31) 13.81,42.35 arc(13.78,42.36) 13.75,42.38 arc(13.64,42.41) 13.53,42.42 arc(13.32,42.39) v1(13.13,42.29)
GPIO46: length 16.3
  Top Layer w0.152: v1(11.3,41.91) 11.41,41.91 U3.52
  Bottom Layer w0.152: J1.20 18.27,49.96 arc(17.98,49.9) 17.73,49.74 17.5,49.5 arc(17.33,49.25) 17.27,48.96 17.27,43.09 arc(17.26,42.99) 17.23,42.89 arc(17.12,42.71) 16.95,42.6 arc(16.85,42.57) 16.74,42.56 14.22,42.56 arc(14.03,42.59) 13.84,42.67 arc(13.73,42.75) 13.6,42.77 12.48,42.77 arc(12.19,42.72) 11.94,42.55 v1(11.3,41.91)
GPIO47: length 25.9
  Top Layer w0.152: U3.37 13.32,37.06 arc(13.43,36.98) 13.56,36.96 15.81,36.96 arc(16.65,36.61) 16.99,35.78 16.99,17.85 arc(17.05,17.55) 17.22,17.31 17.36,17.17 arc(17.61,17) 17.9,16.94 J1.7
GPIO48: length 37.5
  Top Layer w0.152: 16.64,14.38 16.64,35.61 arc(16.32,36.38) 15.55,36.7 13.31,36.7 arc(13.13,36.74) 12.97,36.85 U3.36 ; 16.64,14.38 16.66,14.4 J1.6 ; 16.64,14.38 16.64,6.92 arc(16.56,6.56) 16.36,6.25 R25.2 16.13,5.96
RTS: length 6.8
  Top Layer w0.152: Q2.2 15.68,14.64 15.68,16.54 ; 15.68,16.54 15.68,17.13 R17.1 ; 15.68,16.54 14.38,16.54 arc(14.1,16.59) 13.85,16.76 13.16,17.44 arc(12.98,17.72) 12.91,18.05 U24.6
SPICLK: length 18.7
  Top Layer w0.152: U5.6 14.92,30.54 arc(15.02,30.56) 15.11,30.61 arc(15.15,30.64) 15.18,30.67 arc(15.22,30.76) v1(15.24,30.86) 15.37,30.99 15.37,34.96 arc(15.09,35.62) 14.43,35.9 12.44,35.9 arc(12.23,35.94) 12.06,36.06 U3.33
  Bottom Layer w0.152: U4.6 9.53,31.88 arc(9.62,31.41) 9.89,31 10.4,30.49 arc(10.84,30.2) 11.35,30.1 14.48,30.1 arc(15.02,30.32) v1(15.24,30.86)
SPICS0: length 8.1
  Top Layer w0.152: U5.1 7.18,33.08 7.24,33.15 v1(7.24,34.42) ; U3.32 12.09,35.46 arc(12.17,35.34) v1(12.19,35.2)
  Bottom Layer w0.152: v1(7.24,34.42) 7.76,34.94 arc(8.05,35.13) 8.4,35.2 v1(12.19,35.2)
SPICS1: length 9.5
  Top Layer w0.152: v1(11.18,28.77) 10.82,29.12 10.82,33.45 arc(10.74,33.86) 10.51,34.2 U3.28
  Bottom Layer w0.152: v1(11.18,28.77) 11.94,28 arc(12.03,27.86) 12.06,27.7 U4.1
SPID: length 23.4
  Top Layer w0.152: U3.35 12.72,36.53 arc(12.82,36.46) 12.95,36.43 15.23,36.43 arc(15.87,36.17) 16.13,35.54 16.13,28.45 arc(16,28.14) 15.68,28 13.97,28 arc(13.77,28.09) 13.69,28.28 U5.5 v1(12.19,29.27)
  Bottom Layer w0.152: U4.5 8.25,32.83 8.76,32.32 arc(9,31.97) 9.08,31.55 9.08,31.32 arc(9.18,30.83) 9.46,30.41 10.25,29.62 arc(10.63,29.36) 11.09,29.27 v1(12.19,29.27)
SPIHD: length 12
  Top Layer w0.152: v1(12.19,30.86) 12.19,31.81 ; U3.30 10.82,35.6 arc(10.72,35.66) 10.6,35.69 10.56,35.69 arc(10.42,35.66) 10.31,35.58 arc(10.24,35.48) 10.22,35.36 10.22,35.24 arc(10.25,35.08) 10.34,34.94 10.95,34.33 arc(11.12,34.08) 11.18,33.79 11.18,32.7 arc(11.23,32.41) 11.4,32.16 11.52,32.04 arc(11.77,31.87) 12.06,31.81 U5.7
  Bottom Layer w0.152: U4.7 10.85,33.52 10.85,31.31 arc(10.98,30.99) 11.3,30.86 v1(12.19,30.86)
SPIQ: length 27.2
  Top Layer w0.152: U5.2 v1(8.25,31.81) ; U3.34 12.43,36.25 arc(12.54,36.18) 12.66,36.15 14.84,36.15 arc(15.48,35.89) 15.75,35.24 15.75,29.78 arc(15.6,29.42) v1(15.24,29.27)
  Bottom Layer w0.152: v1(8.25,31.81) 8.5,31.56 arc(8.7,31.28) 8.76,30.94 8.76,30.71 arc(8.86,30.2) 9.15,29.78 10.53,28.39 arc(10.73,28.1) 10.79,27.76 U4.2 10.79,25.04 arc(10.87,24.84) 11.07,24.77 12.13,24.77 arc(12.54,24.85) 12.88,25.08 14.9,27.09 arc(15.15,27.47) 15.24,27.91 v1(15.24,29.27)
SPIWP: length 28.9
  Top Layer w0.152: U3.31 11.59,35.39 arc(11.66,35.29) 11.68,35.17 11.68,35.01 arc(11.72,34.81) 11.84,34.64 12.06,34.42 arc(12.42,34.18) 12.83,34.1 v1(12.95,34.1) ; U5.3 7.94,30.54 v1(8.25,30.86)
  Bottom Layer w0.152: v1(12.95,34.1) 13.28,34.43 arc(13.48,34.56) 13.71,34.61 14.44,34.61 arc(14.71,34.55) 14.94,34.4 15.61,33.73 arc(15.9,33.3) 16,32.78 16,27.66 arc(15.91,27.21) 15.66,26.84 13.06,24.24 arc(12.73,24.02) 12.34,23.94 9.96,23.94 arc(9.65,24.07) 9.53,24.38 U4.3 9.53,28.07 arc(9.41,28.65) 9.08,29.15 8.64,29.59 arc(8.36,30.01) 8.25,30.52 v1(8.25,30.86)
U0TX: length 25.9
  Top Layer w0.152: v1(14.73,39.33) 14.39,39.33 arc(14.1,39.38) 13.86,39.55 12.53,40.87 arc(12.46,40.97) 12.44,41.1 arc(12.47,41.23) 12.54,41.34 U3.49 ; R24.1 15.55,21.02 arc(15.59,20.79) 15.72,20.6 v1(15.81,20.51)
  Bottom Layer w0.152: v1(15.81,20.51) 16.45,20.51 arc(17.03,20.75) 17.27,21.34 17.27,32.57 arc(17.16,33.1) 16.86,33.56 14.69,35.73 arc(14.35,36.25) 14.22,36.86 14.22,38.5 arc(14.28,38.79) 14.45,39.04 v1(14.73,39.32)
USB_D+: length 21.4
  Top Layer w0.241: U2.B6 10.9,7.16 10.56,7.49 v1(10.16,7.49) ; U16.15 9.88,7.77 v1(10.16,7.49) ; R22.1 4.71,17.53 v1(4.13,17.53) ; v1(10.16,7.49) 9.9,7.23 U2.A6
  Bottom Layer w0.241: v1(4.13,17.53) 4.13,17.04 6.08,15.08 6.08,11.89 arc(6.14,11.59) 6.31,11.35 6.51,11.14 arc(6.67,10.9) 6.73,10.61 6.73,7.77 arc(7,7.13) 7.65,6.86 9.21,6.86 arc(9.36,6.87) 9.5,6.92 arc(9.63,6.99) 9.75,7.08 v1(10.16,7.49) 10.68,8.01 arc(10.86,8.28) TP1.1
USB_D-: length 21.4
  Top Layer w0.241: v1(4.13,18.22) 4.66,18.22 R23.1 ; 10.4,6.23 10.4,5.38 10.22,5.21 9.54,5.21 9.4,5.36 9.4,7.24 v1(9.14,7.49) 9.38,7.73 U16.14
  Bottom Layer w0.241: v1(4.13,18.22) 4.19,18.22 4.65,17.76 4.65,17.07 6.48,15.24 6.48,12.05 arc(6.54,11.76) 6.7,11.51 6.9,11.31 arc(7.07,11.06) 7.12,10.77 7.12,7.77 arc(7.28,7.4) 7.65,7.25 8.9,7.25 arc(9.07,7.32) v1(9.14,7.49) arc(9.35,7.8) 9.42,8.16 9.42,8.57
XIN: length 2.6
  Top Layer w0.241: 9.24,14.97 9.68,14.53 arc(9.81,14.35) 9.88,14.14 U16.4
XOUT: length 4.4
  Top Layer w0.241: 10.38,14.24 10.38,14.18 ; 10.38,14.18 U16.3 ; 10.38,14.18 arc(10.35,14.33) 10.26,14.46 arc(10.19,14.65) 10.16,14.85 10.16,15.24 10.18,15.51 arc(10.2,15.61) 10.27,15.71 X2.3
XTAL_N: length 6
  Top Layer w0.203: X1.3 15.76,44.08 15.54,44.3 12.8,44.3 C34.1 12.38,44.2 arc(12.21,44.13) 12.14,43.96 12.14,43.59 arc(12.07,43.23) 11.87,42.93 U3.53
XTAL_P: length 2.4
  Top Layer w0.203: C33.2 L8.2 14.12,45.14
$1N4043: length 5
  Top Layer w0.152: U2.B5 11.9,8.29 arc(11.98,8.48) 12.17,8.56 14.68,8.56 arc(14.68,8.56) 14.68,8.56
$1N4044: length 24.3
  Top Layer w0.152: v1(4.19,6.67) 3.56,6.67 arc(2.71,7.02) 2.36,7.86 2.36,10.72 arc(2.44,11.12) 2.67,11.46 arc(2.86,11.74) 2.92,12.07 2.92,16.32 arc(2.94,16.46) 2.99,16.58 3.33,16.91 arc(3.54,17.24) 3.62,17.62 3.62,19.01 ; 3.62,19.01 3.62,19.14 ; 3.62,19.01 arc(3.62,19.08) 3.62,19.14 ; 3.62,19.14 arc(3.67,19.31) 3.77,19.46 4.06,19.75 ; 4.74,19.88 4.39,19.88 arc(4.22,19.84) 4.06,19.75 ; 4.06,19.75 arc(4.05,19.73) 4.03,19.72 ; U2.A5 8.89,6.22 v1(8.89,5.08)
  Bottom Layer w0.152: v1(4.19,6.67) 4.19,4.81 arc(4.41,4.28) 4.94,4.06 7.56,4.06 arc(7.85,4.12) 8.1,4.29 v1(8.89,5.08)
$1N4117: length 1.5
  Top Layer w0.152: 10.16,26.23 10.41,26.47 BOOT.1
$1N4141: length 1.5
  Top Layer w0.152: R13.2 PWR.2
$1N4145: length 1.6
  Top Layer w0.152: Q2.1 14.68,14.5 14.68,12.95
$1N4146: length 1.5
  Top Layer w0.152: 14.68,17.27 14.61,17.34 Q1.1
$1N12244: length 1.5
  Top Layer w0.152: 16.13,5.09 LED1.1
$1N15135: length 3.7
  Top Layer w0.203: 8.76,43.69 8.95,43.69 U3.2 ; 8.76,43.69 8.58,43.51 8.58,43.49 8.71,43.37 ; 8.76,43.69 8.38,43.69 ; 8.71,43.37 8.45,43.37 ; 8.71,43.37 9.09,42.99
  Top Layer w0.508: 8.45,43.52 7.17,43.52 L4.2
$1N27024: length 2.4
  Top Layer w0.203: U3.1 9.25,43.95
  Top Layer w0.35: L6.1 7.88,45.29 7.87,45.29 ; 8.64,44.56 9.25,43.95
$1N27033: length 3.8
  Top Layer w0.35: C54.1 L7.1 7.87,49.46 U25.1
$1N27209: length 2.3
  Top Layer w0.203: U3.54 11.69,43.32 arc(11.78,43.45) 11.81,43.6 L8.1

## Copper pours and planes (outline as drawn; the poured copper is in the pictures)
3V3 on Top Layer: 5.21,16.77 5,16.98 3.61,16.98 3.24,16.61 3.24,13.46 3.68,13.02 5.02,13.02 5.21,13.21
3V3 on Bottom Layer: 0.05,3.19 0.05,10.8 1.7,10.8 2.1,11.19 2.1,16.53 2.33,16.76 4.12,16.76 5.24,15.64 5.24,8.05 3.83,6.63 3.83,3.78 3.24,3.19
3V3 on VCC: 0.26,51.4 20.06,51.4 20.06,5.02 0.26,5.02
+5V on Top Layer: 7.43,6.6 7.24,6.79 3.47,6.79 2.44,7.82 2.44,11.84 3.49,12.89 5.85,12.89 6.48,12.27 6.48,10.41 6.41,10.35 5.91,10.35 5.84,10.41 5.84,11.44 5.71,11.57 4.75,11.57 4.64,11.46 4.64,10.41 5.21,9.83 5.21,8.17 5.44,7.95 7.61,7.95 8.06,7.49 8.06,5.51 8.75,4.83 11.43,4.83 12.26,5.65 12.26,6.73 12.32,6.79 12.76,6.79 12.83,6.73 12.83,3.87 12.38,3.43 8.01,3.43 7.43,4.01
+5V on Top Layer: 12.83,6.79 13.08,7.05 13.84,7.05 14.1,7.3 14.1,7.66 13.82,7.94 12.51,7.94 12.26,7.68 12.26,6.35 12.32,6.29 12.83,6.29
+5V on VCC: 0.37,12.76 19.93,12.76 19.93,0.32 0.37,0.32
GND on Top Layer: 0,51.7 20.32,51.7 20.32,0 0,0
GND on Bottom Layer: 0,51.7 20.32,51.7 20.32,0 0,0
GND on GND: 0.26,51.4 20.06,51.4 20.06,0.26 0.26,0.26

## Text on the board
Bottom Silkscreen Layer: PSRAM
Top Silkscreen Layer: PWR | G48 | RST | BOOT
